# Altium schematic sheet S67_01_3913.SchDoc
size A4
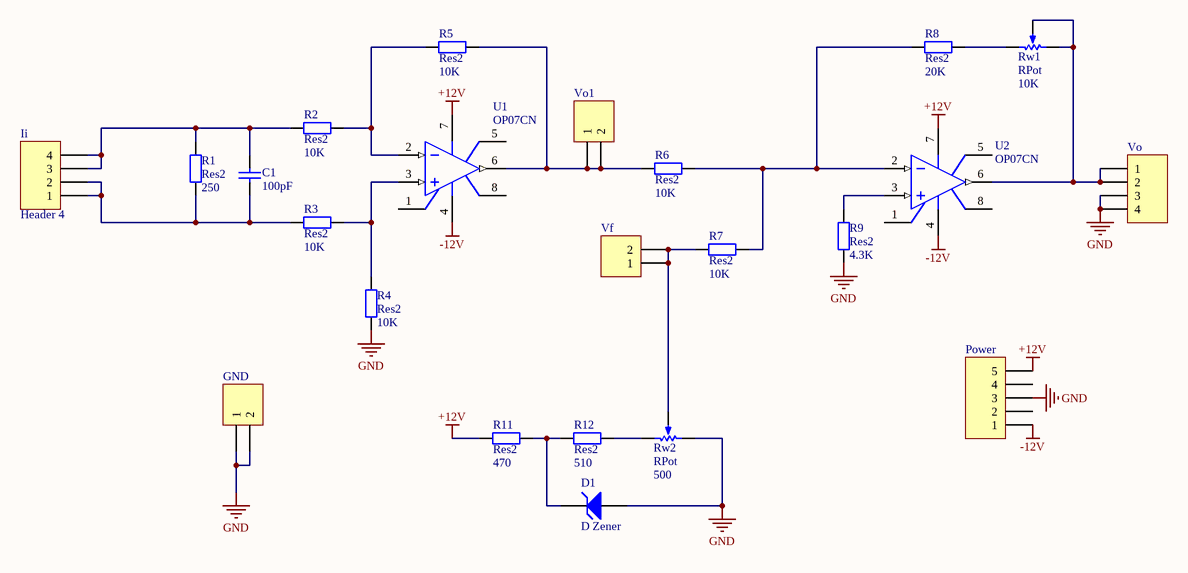
[diagram p0: S67_01_3913.SchDoc]

## Parts
C1  value 100pF  [RAD0.2]  (hidden comment: Cap)
D1  D Zener  [DIODE0.4]
GND  Header 2  [HDR1X2]  (value not drawn)
Ii  Header 4  [HDR1X4]
Power  Header 5  [POWER PLUG5]  (value not drawn)
R1  Res2  value 250  [AXIAL-0.4]
R2  Res2  value 10K  [AXIAL-0.4]
R3  Res2  value 10K  [AXIAL-0.4]
R4  Res2  value 10K  [AXIAL-0.4]
R5  Res2  value 10K  [AXIAL-0.4]
R6  Res2  value 10K  [AXIAL-0.4]
R7  Res2  value 10K  [AXIAL-0.4]
R8  Res2  value 20K  [AXIAL-0.4]
R9  Res2  value 4.3K  [AXIAL-0.4]
R11  Res2  value 470  [AXIAL-0.4]
R12  Res2  value 510  [AXIAL-0.4]
Rw1  RPot  value 10K  [VR5]
Rw2  RPot  value 500  [VR5]
U1  OP07CN  [DIP8]
U2  OP07CN  [DIP8]
Vf  Header 2  [HDR1X2]  (value not drawn)
Vo  Header 4  [HDR1X4]  (value not drawn)
Vo1  Header 2  [HDR1X2]  (value not drawn)

## Nets
+12V: Power.1(5) R11.2 U1.7(V+) U2.7(V+)
-12V: Power.5(1) U1.4(V-) U2.4(V-)
GND: D1.1(A) GND.1 GND.2 Power.3 R4.2 R9.1 Rw2.1(BOT) Vo.3 Vo.4
NetC1_1: C1.1 Ii.1 Ii.2 R1.1 R3.2
NetC1_2: C1.2 Ii.3 Ii.4 R1.2 R2.2
NetD1_2: D1.2(K) R11.1 R12.2
NetR2_1: R2.1 R5.1 U1.2(IN-)
NetR3_1: R3.1 R4.1 U1.3(IN+)
NetR5_2: R5.2 R6.1 U1.6(OUT) Vo1.1 Vo1.2
NetR6_2: R6.2 R7.2 R8.1 U2.2(IN-)
NetR7_1: R7.1 Rw2.2(TAP) Vf.1 Vf.2
NetR8_2: R8.2 Rw1.3(TOP)
NetR9_2: R9.2 U2.3(IN+)
NetR12_1: R12.1 Rw2.3(TOP)
NetRw1_1: Rw1.1(BOT) Rw1.2(TAP) U2.6(OUT) Vo.1 Vo.2

Not connected (* = marked no-connect by the designer): Power 2(4) 4(2); U1 1(NULL1) 5(NC) 8(NULL2); U2 1(NULL1) 5(NC) 8(NULL2)

## Library data of the parts
C1 = Cap: Capacitor; Published: 8-Jun-2000; LatestRevisionDate: 17-Jul-2002; LatestRevisionNote: Re-released for DXP Platform.; PackageReference: RAD-0.3; Publisher: Altium Limited
D1 = D Zener: Zener Diode; Published: 8-Jun-2000; LatestRevisionDate: 17-Jul-2002; LatestRevisionNote: Re-released for DXP Platform.; PackageReference: DIODE-0.7; Publisher: Altium Limited
GND Vf Vo1 = Header 2: Header, 2-Pin; LatestRevisionDate: 17-Jul-2002; LatestRevisionNote: Re-released for DXP Platform.; Publisher: Altium Limited
Ii Vo = Header 4: Header, 4-Pin; LatestRevisionDate: 17-Jul-2002; LatestRevisionNote: Re-released for DXP Platform.; Publisher: Altium Limited
Power = Header 5: Header, 5-Pin; LatestRevisionDate: 17-Jul-2002; LatestRevisionNote: Re-released for DXP Platform.; Publisher: Altium Limited
R1-R9 R11 R12 = Res2: Resistor; Published: 8-Jun-2000; LatestRevisionDate: 17-Jul-2002; LatestRevisionNote: Re-released for DXP Platform.; PackageReference: AXIAL-0.4; Publisher: Altium Limited
Rw1 Rw2 = RPot: Potentiometer; Sim Note: Enter the Resistance value and the set point into parameter fields.; Set Position: 0.5; Published: 8-Jun-2000; LatestRevisionDate: 17-Jul-2002; LatestRevisionNote: Re-released for DXP Platform.; PackageReference: VR5; Publisher: Altium Limited
U1 U2 = OP07CN: Very Low Offset Single Bipolar Operational Amplifier; Note: Pins 5 is Not Connected; Published: 24-Aug-2001; LatestRevisionDate: 06-Jun-2005; LatestRevisionNote: Stylized 3D Model Added.; DatasheetVersion: Oct-1997; PackageReference: DIP8; Publisher: Altium Limited; PackageDescription: DIP; 8 Leads; Row Spacing 7.62 mm; Pitch 2.54 mm; Code_JEDEC: MO-001-AN; ComponentLink1Description: Manufacturer Link; ComponentLink1URL: http://www.st.com/; ComponentLink2Description: Datasheet; ComponentLink2URL: http://www.st.com/stonline/products/literature/ds/2184/op07.pdf